# Altium schematic sheet Connector_Sheet.SchDoc
size A4; DocumentNumber: 9; SheetNumber: 9; SheetTotal: 11
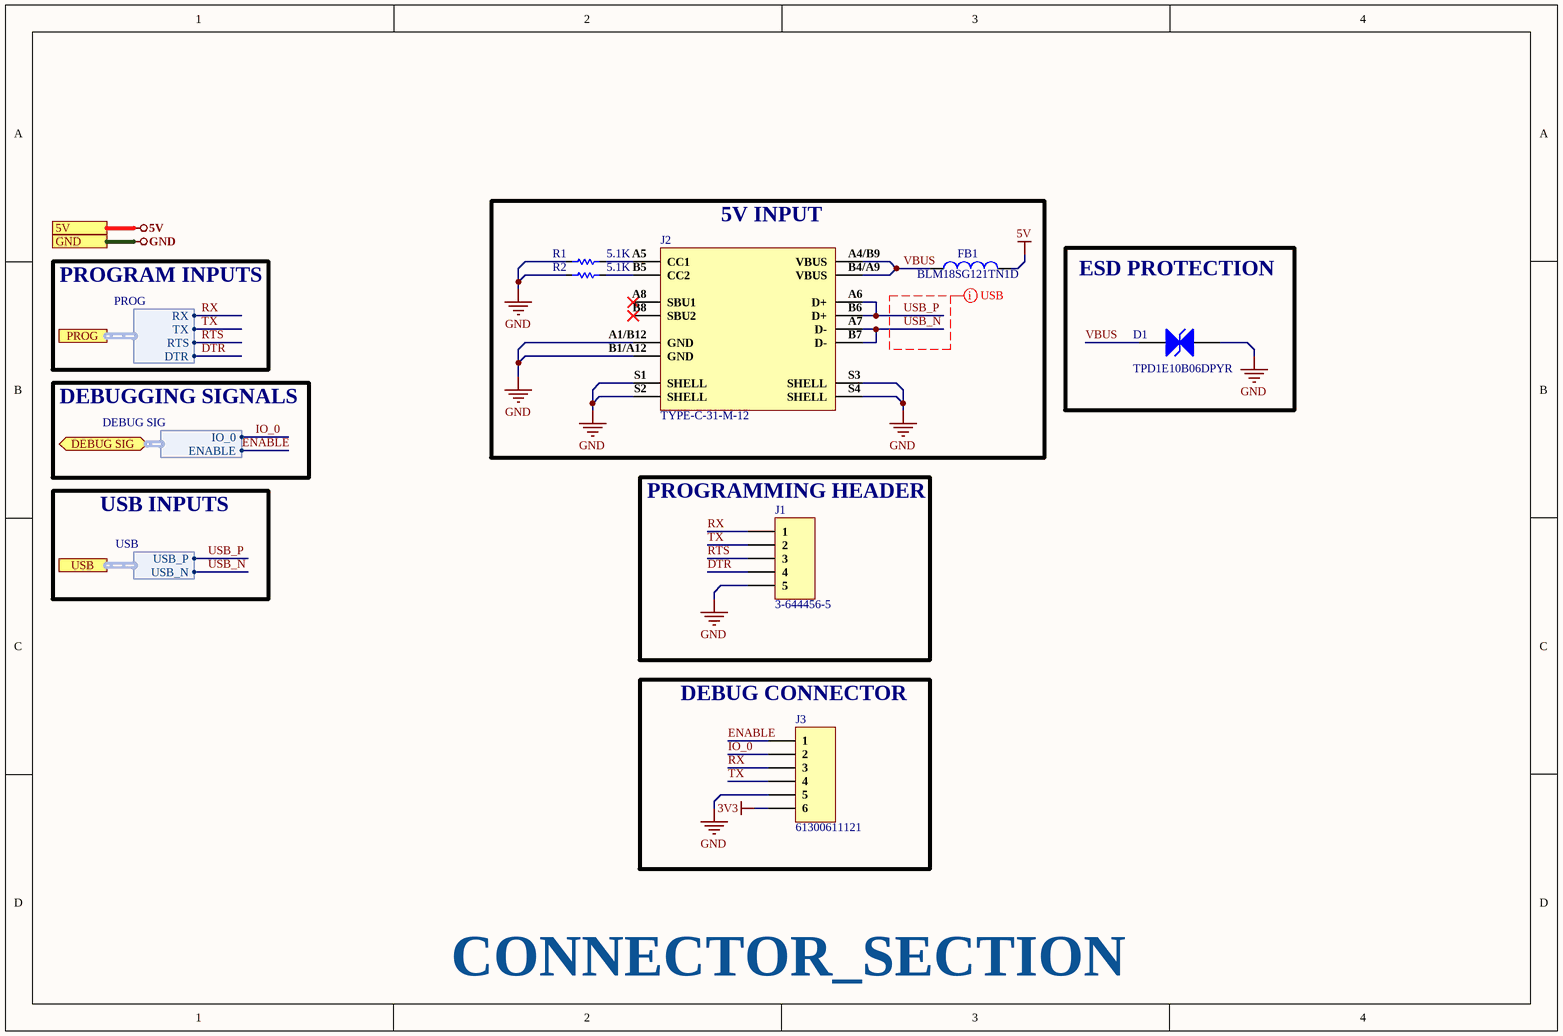
[diagram p0: Connector_Sheet.SchDoc]

## Parts
D1  TPD1E10B06DPYR  [X1SON - 0.45 mm max height]
FB1  BLM18SG121TN1D  [IND-0603 (1608 Metric)]
J1  3-644456-5  [HDR1X5]
J2  TYPE-C-31-M-12  [TYPE-C-31-M-12_]
J3  61300611121  [HDR1X6]
R1  5.1K  [Res-0603]
R2  5.1K  [Res-0603]

## Blocks framed on the sheet
5V INPUT: FB1 J2 R1 R2
ESD PROTECTION: D1
PROGRAMMING HEADER: J1
DEBUG CONNECTOR: J3

## Ports
5V, DEBUG SIG (bidir, harness DEBUG SIG), GND, PROG (harness PROG), USB (harness USB)

## Harnesses
PROG: RX, TX, RTS, DTR
DEBUG SIG: IO_0, ENABLE
USB: USB_P, USB_N

## Nets
3V3: J3.6
5V: FB1.2 ; port 5V
GND: D1.1 J1.5 J2.A1/B12(GND) J2.B1/A12(GND) J2.S1(SHELL) J2.S2(SHELL) J2.S3(SHELL) J2.S4(SHELL) J3.5 R1.1 R2.1 ; port GND
DTR: J1.4 ; port PROG.DTR
ENABLE: J3.1 ; port DEBUG SIG.ENABLE
IO_0: J3.2 ; port DEBUG SIG.IO_0
RTS: J1.3 ; port PROG.RTS
RX: J1.1 J3.3 ; port PROG.RX
TX: J1.2 J3.4 ; port PROG.TX
USB_N: J2.A7(D-) J2.B7(D-) ; port USB.USB_N
USB_P: J2.A6(D+) J2.B6(D+) ; port USB.USB_P
VBUS: D1.2 FB1.1 J2.A4/B9(VBUS) J2.B4/A9(VBUS)
NetJ2_A5: J2.A5(CC1) R1.2
NetJ2_B5: J2.B5(CC2) R2.2

Not connected (* = marked no-connect by the designer): J2 A8(SBU1)* B8(SBU2)*

## Layout directives
differential pair; net class USB; differential pair class USB_Lines; rule Matched Net Lengths [Tolerance = 20mil]; rule Impedance Constraint [Min = 85.00    Max = 95.00    ]: USB_N, USB_P

## Notes on the sheet
- PROGRAM INPUTS
- DEBUGGING SIGNALS
- USB INPUTS
- CONNECTOR_SECTION
- File:
- Title:
- Date:
- Page
- Num:
- Total:
- Drawn By: Huzaifa Ali

## Library data of the parts
D1 = TPD1E10B06DPYR: DIODE TVS SMD 5.5V 5A 90W; Manufacturer: Texas Instruments; Capacitance: 12pF; Direction: Bidirectional; Breakdown Voltage: 6V; Number of Channels: 1; Clamping Voltage: 14V; Power Line Protection: No; Leakage Current: 100nA; ESD Protection: Yes; Test Current: 1mA; Element Configuration: Single; Interface: GPIO; Diode Type: ZENER; Supplier 1: Mouser; Manufacturer Part Number: TPD1E10B06DPYR; RoHS: Yes; Category: TVS Diodes; Pricing 1: 1=0.39000, 10=0.29800, 50=0.29800, 100=0.18600, 500=0.12700, 1000=0.09800, 2500=0.08300, 10000=0.07500 (USD); Case/Package: SON; Number of Pins: 2; Contact Plating: Gold; Min Operating Temperature: -40°C; Max Operating Temperature: 125°C; Package Quantity: 1; Packaging: Tape and Reel; Number of Bidirectional Channels: 1; Reverse Standoff Voltage: 5.5V; Min Breakdown Voltage: 6V; Peak Pulse Power: 90W; Working Voltage: 5.5V; Max Reverse Leakage Current: 100nA; Peak Pulse Current: 5A; Resistor Type: Zener; Series: -; Length: 1.1mm; Width: 0.7mm; Height: 0.35mm; Radiation Hardening: No; REACH SVHC: No SVHC; Lead Free: Lead Free; RoHS Compliant: Yes; ComponentLink1URL: https://datasheet.ciiva.com/22691/1877100-22691786.pdf?src-supplier=Element14; ComponentLink1Description: https://datasheet.ciiva.com/22691/1877100-22691786.pdf?src-supplier=Element14; ComponentLink2URL: https://datasheet.ciiva.com/46384/1877100-46384054.pdf?src-supplier=Element14; ComponentLink2Description: https://datasheet.ciiva.com/46384/1877100-46384054.pdf?src-supplier=Element14; ComponentLink3URL: https://datasheet.ciiva.com/2961/tpd1e10b06-2961245.pdf?src-supplier=Digi-Key; ComponentLink3Description: https://datasheet.ciiva.com/2961/tpd1e10b06-2961245.pdf?src-supplier=Digi-Key; ComponentLink4URL: https://datasheet.ciiva.com/6574/tpd1e10b06-6574654.pdf?src-supplier=Digi-Key; ComponentLink4Description: https://datasheet.ciiva.com/6574/tpd1e10b06-6574654.pdf?src-supplier=Digi-Key; ComponentLink5URL: https://datasheet.ciiva.com/2961/tpd1e10b06-2961246.pdf?src-supplier=Digi-Key; ComponentLink5Description: https://datasheet.ciiva.com/2961/tpd1e10b06-2961246.pdf?src-supplier=Digi-Key; ComponentLink6URL: https://datasheet.ciiva.com/14195/tpd1e10b06-14195178.pdf?src-supplier=Avnet; ComponentLink6Description: https://datasheet.ciiva.com/14195/tpd1e10b06-14195178.pdf?src-supplier=Avnet; Supplier Part Number 1: 595-TPD1E10B06DPYR
FB1 = BLM18SG121TN1D: FERRITE BEAD 120 OHM 0603 1LN; Manufacturer: Murata; Material: Steel,Ferrite; Tolerance: 25%; Impedance: 120R; DC Resistance (DCR): 25mR; Max DC Current: 3A; Number of Lines: 1; Test Frequency: 100MHz; Shielding: Unshielded; Supplier 1: Arrow Electronics; Manufacturer Part Number: BLM18SG121TN1D; RoHS: Yes; Category: Ferrite Beads and Chips; Stock 1: 82612; Pricing 1: 1=0.12640, 10=0.08350, 25=0.07210, 100=0.05150, 250=0.04730, 500=0.04110, 1000=0.03420, 3000=0.03360, 6000=0.03320, 15000=0.03270, 30000=0.03200, 75000=0.03150 (USD); Case/Package: 0603; Number of Pins: 2; Core Material: Ferrite; Case Code (Metric): 1608; Case Code (Imperial): 0603; Min Operating Temperature: -55°C; Max Operating Temperature: 125°C; Package Quantity: 1; Max Current Rating: 3A; Packaging: Tape and Reel; Current Rating: 3A; Termination: SMD/SMT; Frequency: 100MHz; Number of Circuits: 1; Series: BLM18S; DC Resistance-Max: 25mR; Length: 1.6mm; Width: 0.8mm; Height: 0.8mm; Depth: 0.8mm; Reach SVHC Compliant: Yes; Lead Free: Lead Free; RoHS Compliant: Yes; ComponentLink1URL: https://datasheet.ciiva.com/1012/l0110s0100blm18s-1012624.pdf?src-supplier=Digi-Key; ComponentLink1Description: https://datasheet.ciiva.com/1012/l0110s0100blm18s-1012624.pdf?src-supplier=Digi-Key; ComponentLink2URL: https://datasheet.ciiva.com/11799/0900766b811b5866-11799181.pdf?src-supplier=RSComponents; ComponentLink2Description: https://datasheet.ciiva.com/11799/0900766b811b5866-11799181.pdf?src-supplier=RSComponents; ComponentLink3URL: https://datasheet.ciiva.com/18093/getdatasheetpartid-295885-18093249.pdf?src-supplier=Verical; ComponentLink3Description: https://datasheet.ciiva.com/18093/getdatasheetpartid-295885-18093249.pdf?src-supplier=Verical; ComponentLink4URL: https://datasheet.ciiva.com/41449/001171723-da-01-en-chip-drossel0603-120r-3000ma-1-6x0-8mm-41449353.pdf?src-supplier=Conrad; ComponentLink4Description: https://datasheet.ciiva.com/41449/001171723-da-01-en-chip-drossel0603-120r-3000ma-1-6x0-8mm-41449353.pdf?src-supplier=Conrad; ComponentLink5URL: https://datasheet.ciiva.com/41449/001172312-da-01-en-drossel-0603-120r-1-6x0-8mm-10000st-41449675.pdf?src-supplier=Conrad; ComponentLink5Description: https://datasheet.ciiva.com/41449/001172312-da-01-en-drossel-0603-120r-1-6x0-8mm-10000st-41449675.pdf?src-supplier=Conrad; ComponentLink6URL: https://datasheet.ciiva.com/8021/5151-8021511.pdf?src-supplier=Element14; ComponentLink6Description: https://datasheet.ciiva.com/8021/5151-8021511.pdf?src-supplier=Element14; ComponentLink7URL: https://datasheet.ciiva.com/8021/5151-8021512.pdf?src-supplier=Element14; ComponentLink7Description: https://datasheet.ciiva.com/8021/5151-8021512.pdf?src-supplier=Element14; ComponentLink8URL: https://datasheet.ciiva.com/14122/blm-series-eng-tds-14122906.pdf?src-supplier=Distrelec; ComponentLink8Description: https://datasheet.ciiva.com/14122/blm-series-eng-tds-14122906.pdf?src-supplier=Distrelec; ComponentLink9URL: https://datasheet.ciiva.com/1012/l0110s0100blm18s-1012623.pdf?src-supplier=Digi-Key; ComponentLink9Description: https://datasheet.ciiva.com/1012/l0110s0100blm18s-1012623.pdf?src-supplier=Digi-Key; ComponentLink10URL: https://datasheet.ciiva.com/1012/l0110s0100blm18s-1012625.pdf?src-supplier=Digi-Key; ComponentLink10Description: https://datasheet.ciiva.com/1012/l0110s0100blm18s-1012625.pdf?src-supplier=Digi-Key; ComponentLink11URL: https://datasheet.ciiva.com/16395/l0110s0100blm18s-16395498.pdf?src-supplier=Future+Electronics; ComponentLink11Description: https://datasheet.ciiva.com/16395/l0110s0100blm18s-16395498.pdf?src-supplier=Future+Electronics; Supplier Part Number 1: BLM18SG121TN1D; LCSC Part Number: C113030; Item Type: Ferrite Bead
J1 = 3-644456-5: 05P MTA100 HDR ASSY (NARROW); Manufacturer: TE Connectivity; Underplate Material: Nickel; Number of Positions: 5; Connector Type: Plug,Header,Pin; Mating Alignment: No (Without); PCB Mount Retention: Without; Max Voltage Rating (AC): 250V; Connector System: Wire-to-Board; Contact Current Rating: 5A; Contact Resistance: 6mR; Gender: Male; PCB Mounting Orientation: Vertical; Contact Style: Straight; Pitch: 2.54mm; Plating Thickness: 1.27um; PCB Thickness: 0.063inch; Tail Length: 0.11inch; Approvals: CSA; Supplier 1: Digi-Key; Manufacturer Part Number: 3-644456-5; RoHS: Yes; Category: Connectors; Stock 1: 30835; Pricing 1: 1=0.45000, 10=0.39200, 100=0.32330, 500=0.28114, 1000=0.23195, 5000=0.20383, 10000=0.18978 (USD); Mount: Through Hole; Color: Natural; Housing Material: Polyester; Housing Color: Natural; Contact Plating: Tin,Matte; Contact Material: Copper Alloy; Contact Shape: Square; Insulation Material: Thermoplastic; Insulation Color: Natural; Contact Finish - Mating: TIN; Min Operating Temperature: -67°C; Max Operating Temperature: 221°C; Number of Rows: 1; Packaging: Bag; Package Quantity: 500; Contact Gender: Male; Termination: Solder; Orientation: Straight; Number of Contacts: 5; Strain Relief: No (Without); Contact Retention: No (Without); Mating Retention: No (Without); PCB Mount Alignment: No (Without); Sealable: No (Without); Shrouded: No (Without); Voltage Rating: 250V; Voltage Rating (AC): 250V; Current Rating: 5A; Backwall/Post Interruptions: No (Without); Series: MTA-100; Contact Type: Male Pin; Length: 12.4mm; Height: 10.03mm; Contact Mating Length: 7.49mm; Depth: 2.33mm; Radiation Hardening: No; Flammability Rating: UL94 V-0; ELV: Compliant; Lead Free: Lead Free; REACH SVHC: Unknown; ComponentLink1URL: https://datasheet.ciiva.com/16307/3-644456-5-16307486.pdf?src-supplier=Future+Electronics; ComponentLink1Description: https://datasheet.ciiva.com/16307/3-644456-5-16307486.pdf?src-supplier=Future+Electronics; ComponentLink2URL: https://datasheet.ciiva.com/3118/eng-ds-82056-mta-0608-3118213.pdf?src-supplier=Avnet; ComponentLink2Description: https://datasheet.ciiva.com/3118/eng-ds-82056-mta-0608-3118213.pdf?src-supplier=Avnet; ComponentLink3URL: https://datasheet.ciiva.com/30250/8852eng-ds-82056-mta-0608-30250984.pdf?src-supplier=Onlinecomponents.com; ComponentLink3Description: https://datasheet.ciiva.com/30250/8852eng-ds-82056-mta-0608-30250984.pdf?src-supplier=Onlinecomponents.com; ComponentLink4URL: https://datasheet.ciiva.com/14641/70087179-14641766.pdf?src-supplier=Allied+Electronics; ComponentLink4Description: https://datasheet.ciiva.com/14641/70087179-14641766.pdf?src-supplier=Allied+Electronics; ComponentLink5URL: https://datasheet.ciiva.com/709/eng-cd-644456-d2-709724.pdf?src-supplier=Digi-Key; ComponentLink5Description: https://datasheet.ciiva.com/709/eng-cd-644456-d2-709724.pdf?src-supplier=Digi-Key; Supplier Part Number 1: A31115-ND
J2 = TYPE-C-31-M-12: 250mA 1 16 Female Type-C SMD USB Connectors ROHS; Manufacturer: Korean Hroparts Elec; ComponentLink1Description: LCSC; ComponentLink1URL: https://www.lcsc.com/product-detail/USB-Connectors_Korean-Hroparts-Elec-TYPE-C-31-M-12_C165948.html; Manufacturer Part Number: TYPE-C-31-M-12; Footprint: Custom; LCSC Part Number: C165948; Item Type: USB Connector
J3 = e-50004: CONN HEADER VERT 6POS 2.54MM; Manufacturer: Wurth Electronics; Current Rating: 3A; Voltage Rating: 250V; Number of Positions: 6; Gender: Male; Connector Type: Male Pin; Pitch: 0.1inch; Supplier 1: Digi-Key; Manufacturer Part Number: 61300611121; Stock 1: 14573; Pricing 1: 1=0.33, 10=0.279, 25=0.232, 50=0.194, 100=0.176, 1000=0.16 (USD); Mount: Through Hole; Contact Plating: Gold; Contact Material: Copper Alloy,Copper; Housing Material: PBT; Color: Black; Min Operating Temperature: -40°C; Max Operating Temperature: 125°C; Number of Rows: 1; Contact Gender: Male; Packaging: Bulk; Termination: Through Hole; Number of Contacts: 6; Contact Mating Length: 0.236inch; REACH SVHC: Unknown; Lead Free: Lead Free; ComponentLink1URL: http://www.farnell.com/cad/1737268.pdf?src-supplier=Element14; ComponentLink1Description: http://www.farnell.com/cad/1737268.pdf?src-supplier=Element14; ComponentLink2URL: https://katalog.we-online.de/em/datasheet/6130xx11121.pdf?src-supplier=Digi-Key; ComponentLink2Description: https://katalog.we-online.de/em/datasheet/6130xx11121.pdf?src-supplier=Digi-Key; ComponentLink3URL: http://www.mouser.com/ds/2/445/6130xx11121-538006.pdf?src-supplier=Mouser; ComponentLink3Description: http://www.mouser.com/ds/2/445/6130xx11121-538006.pdf?src-supplier=Mouser; Supplier Part Number 1: 732-5319-ND
R1 R2 = RC0603FR-075K1L: RES 5.1K OHM 1% 1/10W 0603; Manufacturer: Yageo; Power Rating: 100mW; Temperature Coefficient: 100ppm/°C; Resistance: 5.1kR; Voltage Rating: 50V; Item Type: Resistor; Supplier 1: Avnet; Manufacturer Part Number: RC0603FR-075K1L; RoHS: Yes; Category: Chip SMD Resistors; Stock 1: 100000; Pricing 1: 5000=0.00133, 10000=0.00131, 20000=0.00127 (USD); Case/Package: 0603; Number of Pins: 2; Case Code (Imperial): 0603; Case Code (Metric): 1608; Size Code: 0603; Min Operating Temperature: -55°C; Max Operating Temperature: 155°C; Tolerance: 1%; Series: RC; Packaging: Tape and Reel; Package Quantity: 1; Termination: SMD/SMT; Resistor Type: Thick Film; Number of Terminations: 2; Max Power Dissipation: 100mW; Voltage Rating (DC): 50V; Features: Moisture Resistant; Resistance Tolerance: 1%; Construction: Rectangular; Length: 0.063inch; Width: 0.031inch; Height: 0.022inch; Depth: 0.8mm; RoHS Compliant: Yes; Reach SVHC Compliant: Yes; Military Standard: Not; Lead Free: Lead Free; ComponentLink1URL: https://datasheet.ciiva.com/46395/443971-46395016.pdf?src-supplier=Element14; ComponentLink1Description: https://datasheet.ciiva.com/46395/443971-46395016.pdf?src-supplier=Element14; ComponentLink2URL: https://datasheet.ciiva.com/2454/pyu-r-int-thick-7-2454046.pdf?src-supplier=Digi-Key; ComponentLink2Description: https://datasheet.ciiva.com/2454/pyu-r-int-thick-7-2454046.pdf?src-supplier=Digi-Key; ComponentLink3URL: https://datasheet.ciiva.com/2454/pyu-r-int-thick-7-2454047.pdf?src-supplier=Digi-Key; ComponentLink3Description: https://datasheet.ciiva.com/2454/pyu-r-int-thick-7-2454047.pdf?src-supplier=Digi-Key; ComponentLink4URL: https://datasheet.ciiva.com/2454/pyu-r-int-thick-7-2454045.pdf?src-supplier=Digi-Key; ComponentLink4Description: https://datasheet.ciiva.com/2454/pyu-r-int-thick-7-2454045.pdf?src-supplier=Digi-Key; ComponentLink5URL: https://datasheet.ciiva.com/15189/getdatasheetpartid-326732-15189786.pdf?src-supplier=Verical; ComponentLink5Description: https://datasheet.ciiva.com/15189/getdatasheetpartid-326732-15189786.pdf?src-supplier=Verical; Supplier Part Number 1: RC0603FR-075K1L; LCSC Part Number: C105580